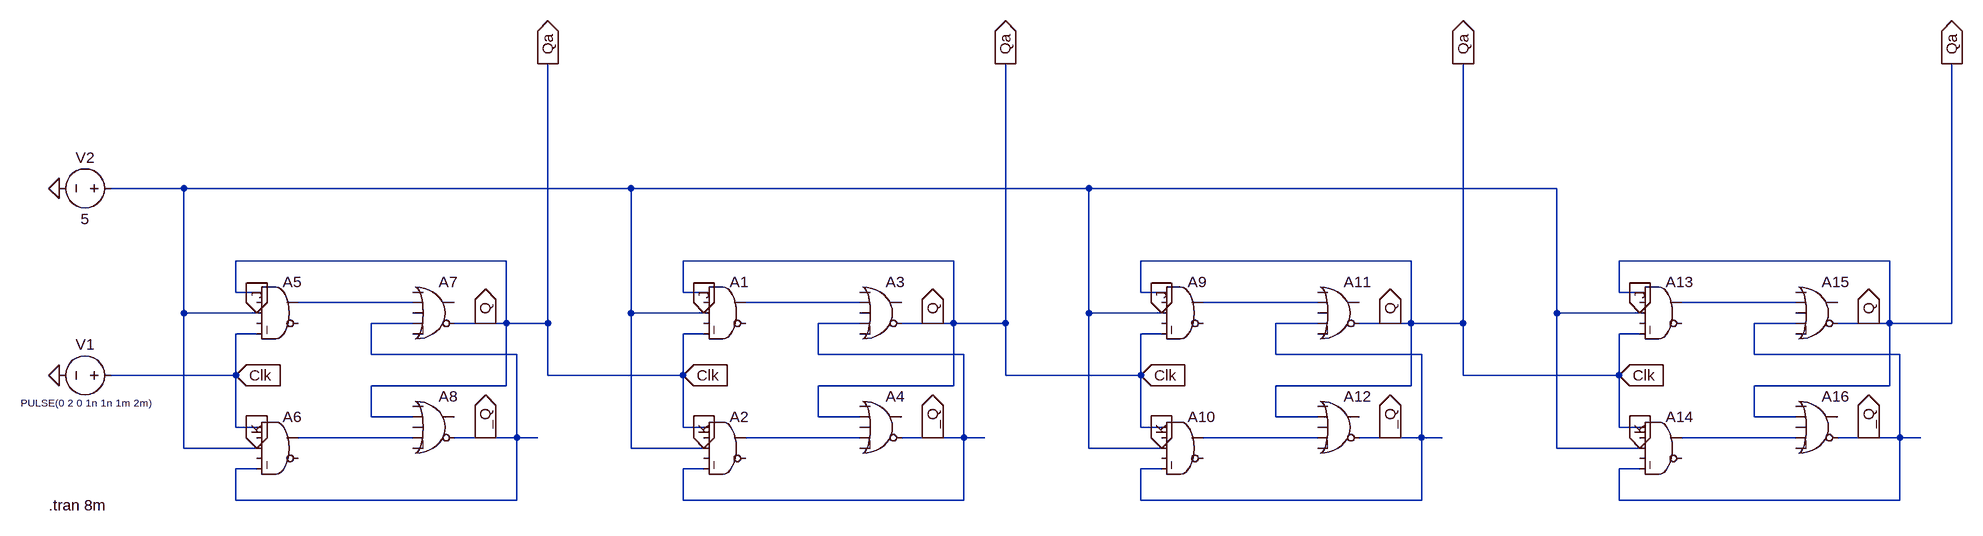
[diagram p0: schematic updownrc.asc]
updownrc.asc, the LTspice schematic file:
Version 4.1
SHEET 1 3416 680
WIRE 656 -160 544 -160
WIRE 1344 -160 656 -160
WIRE 2048 -160 1344 -160
WIRE 2768 -160 2048 -160
WIRE 1152 -48 736 -48
WIRE 1840 -48 1424 -48
WIRE 2544 -48 2128 -48
WIRE 3280 -48 2864 -48
WIRE 736 0 736 -48
WIRE 768 0 736 0
WIRE 1424 0 1424 -48
WIRE 1456 0 1424 0
WIRE 2128 0 2128 -48
WIRE 2160 0 2128 0
WIRE 2864 0 2864 -48
WIRE 2896 0 2864 0
WIRE 1008 16 832 16
WIRE 1696 16 1520 16
WIRE 2400 16 2224 16
WIRE 3136 16 2960 16
WIRE 656 32 656 -160
WIRE 768 32 656 32
WIRE 1344 32 1344 -160
WIRE 1456 32 1344 32
WIRE 2048 32 2048 -160
WIRE 2160 32 2048 32
WIRE 2768 32 2768 -160
WIRE 2896 32 2768 32
WIRE 1008 48 944 48
WIRE 1120 48 1072 48
WIRE 1152 48 1152 -48
WIRE 1152 48 1120 48
WIRE 1216 48 1216 -352
WIRE 1216 48 1152 48
WIRE 1696 48 1632 48
WIRE 1808 48 1760 48
WIRE 1840 48 1840 -48
WIRE 1840 48 1808 48
WIRE 1920 48 1920 -352
WIRE 1920 48 1840 48
WIRE 2400 48 2336 48
WIRE 2512 48 2464 48
WIRE 2544 48 2544 -48
WIRE 2544 48 2512 48
WIRE 2624 48 2624 -352
WIRE 2624 48 2544 48
WIRE 3136 48 3072 48
WIRE 3248 48 3200 48
WIRE 3280 48 3280 -48
WIRE 3280 48 3248 48
WIRE 3376 48 3376 -352
WIRE 3376 48 3280 48
WIRE 768 64 736 64
WIRE 1456 64 1424 64
WIRE 2160 64 2128 64
WIRE 2896 64 2864 64
WIRE 944 96 944 48
WIRE 1168 96 944 96
WIRE 1632 96 1632 48
WIRE 1856 96 1632 96
WIRE 2336 96 2336 48
WIRE 2560 96 2336 96
WIRE 3072 96 3072 48
WIRE 3296 96 3072 96
WIRE 736 128 736 64
WIRE 736 128 544 128
WIRE 1216 128 1216 48
WIRE 1424 128 1424 64
WIRE 1424 128 1216 128
WIRE 1920 128 1920 48
WIRE 2128 128 2128 64
WIRE 2128 128 1920 128
WIRE 2624 128 2624 48
WIRE 2864 128 2864 64
WIRE 2864 128 2624 128
WIRE 1152 144 1152 48
WIRE 1152 144 944 144
WIRE 1840 144 1840 48
WIRE 1840 144 1632 144
WIRE 2544 144 2544 48
WIRE 2544 144 2336 144
WIRE 3280 144 3280 48
WIRE 3280 144 3072 144
WIRE 944 192 944 144
WIRE 1008 192 944 192
WIRE 1632 192 1632 144
WIRE 1696 192 1632 192
WIRE 2336 192 2336 144
WIRE 2400 192 2336 192
WIRE 3072 192 3072 144
WIRE 3136 192 3072 192
WIRE 736 208 736 128
WIRE 768 208 736 208
WIRE 1424 208 1424 128
WIRE 1456 208 1424 208
WIRE 2128 208 2128 128
WIRE 2160 208 2128 208
WIRE 2864 208 2864 128
WIRE 2896 208 2864 208
WIRE 1008 224 832 224
WIRE 1120 224 1072 224
WIRE 1168 224 1168 96
WIRE 1168 224 1120 224
WIRE 1200 224 1168 224
WIRE 1696 224 1520 224
WIRE 1808 224 1760 224
WIRE 1856 224 1856 96
WIRE 1856 224 1808 224
WIRE 1888 224 1856 224
WIRE 2400 224 2224 224
WIRE 2512 224 2464 224
WIRE 2560 224 2560 96
WIRE 2560 224 2512 224
WIRE 2592 224 2560 224
WIRE 3136 224 2960 224
WIRE 3248 224 3200 224
WIRE 3296 224 3296 96
WIRE 3296 224 3248 224
WIRE 3328 224 3296 224
WIRE 656 240 656 32
WIRE 768 240 656 240
WIRE 1344 240 1344 32
WIRE 1456 240 1344 240
WIRE 2048 240 2048 32
WIRE 2160 240 2048 240
WIRE 2768 240 2768 32
WIRE 2896 240 2768 240
WIRE 768 272 736 272
WIRE 1456 272 1424 272
WIRE 2160 272 2128 272
WIRE 2896 272 2864 272
WIRE 736 320 736 272
WIRE 1168 320 1168 224
WIRE 1168 320 736 320
WIRE 1424 320 1424 272
WIRE 1856 320 1856 224
WIRE 1856 320 1424 320
WIRE 2128 320 2128 272
WIRE 2560 320 2560 224
WIRE 2560 320 2128 320
WIRE 2864 320 2864 272
WIRE 3296 320 3296 224
WIRE 3296 320 2864 320
FLAG 736 128 Clk
IOPIN 736 128 In
FLAG 768 32 J
IOPIN 768 32 In
FLAG 768 240 K
IOPIN 768 240 In
FLAG 1120 48 Q
IOPIN 1120 48 Out
FLAG 1120 224 _Q
IOPIN 1120 224 Out
FLAG 1424 128 Clk
IOPIN 1424 128 In
FLAG 1456 32 J
IOPIN 1456 32 In
FLAG 1456 240 K
IOPIN 1456 240 In
FLAG 1808 48 Q
IOPIN 1808 48 Out
FLAG 1808 224 _Q
IOPIN 1808 224 Out
FLAG 2128 128 Clk
IOPIN 2128 128 In
FLAG 2160 32 J
IOPIN 2160 32 In
FLAG 2160 240 K
IOPIN 2160 240 In
FLAG 2512 48 Q
IOPIN 2512 48 Out
FLAG 2512 224 _Q
IOPIN 2512 224 Out
FLAG 2864 128 Clk
IOPIN 2864 128 In
FLAG 2896 32 J
IOPIN 2896 32 In
FLAG 2896 240 K
IOPIN 2896 240 In
FLAG 3248 48 Q
IOPIN 3248 48 Out
FLAG 3248 224 _Q
IOPIN 3248 224 Out
FLAG 1216 -352 Qa
IOPIN 1216 -352 Out
FLAG 1920 -352 Qa
IOPIN 1920 -352 Out
FLAG 2624 -352 Qa
IOPIN 2624 -352 Out
FLAG 3376 -352 Qa
IOPIN 3376 -352 Out
FLAG 464 128 0
FLAG 464 -160 0
SYMBOL Digital\\and 800 -32 R0
SYMATTR InstName A5
SYMBOL Digital\\and 800 176 R0
SYMATTR InstName A6
SYMBOL Digital\\or 1040 -32 R0
SYMATTR InstName A7
SYMBOL Digital\\or 1040 144 R0
SYMATTR InstName A8
SYMBOL Digital\\and 1488 -32 R0
SYMATTR InstName A1
SYMBOL Digital\\and 1488 176 R0
SYMATTR InstName A2
SYMBOL Digital\\or 1728 -32 R0
SYMATTR InstName A3
SYMBOL Digital\\or 1728 144 R0
SYMATTR InstName A4
SYMBOL Digital\\and 2192 -32 R0
SYMATTR InstName A9
SYMBOL Digital\\and 2192 176 R0
SYMATTR InstName A10
SYMBOL Digital\\or 2432 -32 R0
SYMATTR InstName A11
SYMBOL Digital\\or 2432 144 R0
SYMATTR InstName A12
SYMBOL Digital\\and 2928 -32 R0
SYMATTR InstName A13
SYMBOL Digital\\and 2928 176 R0
SYMATTR InstName A14
SYMBOL Digital\\or 3168 -32 R0
SYMATTR InstName A15
SYMBOL Digital\\or 3168 144 R0
SYMATTR InstName A16
SYMBOL voltage 560 128 R90
WINDOW 0 -32 56 VBottom 2
WINDOW 3 32 56 VTop 1
WINDOW 123 0 0 Left 0
WINDOW 39 0 0 Left 0
SYMATTR InstName V1
SYMATTR Value PULSE(0 2 0 1n 1n 1m 2m)
SYMBOL voltage 560 -160 R90
WINDOW 0 -32 56 VBottom 2
WINDOW 3 32 56 VTop 2
WINDOW 123 0 0 Left 0
WINDOW 39 0 0 Left 0
SYMATTR InstName V2
SYMATTR Value 5
TEXT 448 328 Left 2 !.tran 8m

The netlist it stands for:
* updownrc.asc
A5 Qa 0 K 0 Qa 0 N001 0 AND
A6 Qa 0 K 0 _Q 0 N005 0 AND
A7 0 N001 0 _Q 0 Qa 0 0 OR
A8 0 Qa 0 N005 0 _Q 0 0 OR
A1 Qa 0 K 0 Qa 0 N002 0 AND
A2 Qa 0 K 0 _Q 0 N006 0 AND
A3 0 N002 0 _Q 0 Qa 0 0 OR
A4 0 Qa 0 N006 0 _Q 0 0 OR
A9 Qa 0 K 0 Qa 0 N003 0 AND
A10 Qa 0 K 0 _Q 0 N007 0 AND
A11 0 N003 0 _Q 0 Qa 0 0 OR
A12 0 Qa 0 N007 0 _Q 0 0 OR
A13 Qa 0 K 0 Qa 0 N004 0 AND
A14 Qa 0 K 0 _Q 0 N008 0 AND
A15 0 N004 0 _Q 0 Qa 0 0 OR
A16 0 Qa 0 N008 0 _Q 0 0 OR
V1 Qa 0 PULSE(0 2 0 1n 1n 1m 2m)
V2 K 0 5
.tran 8m
.backanno
.end